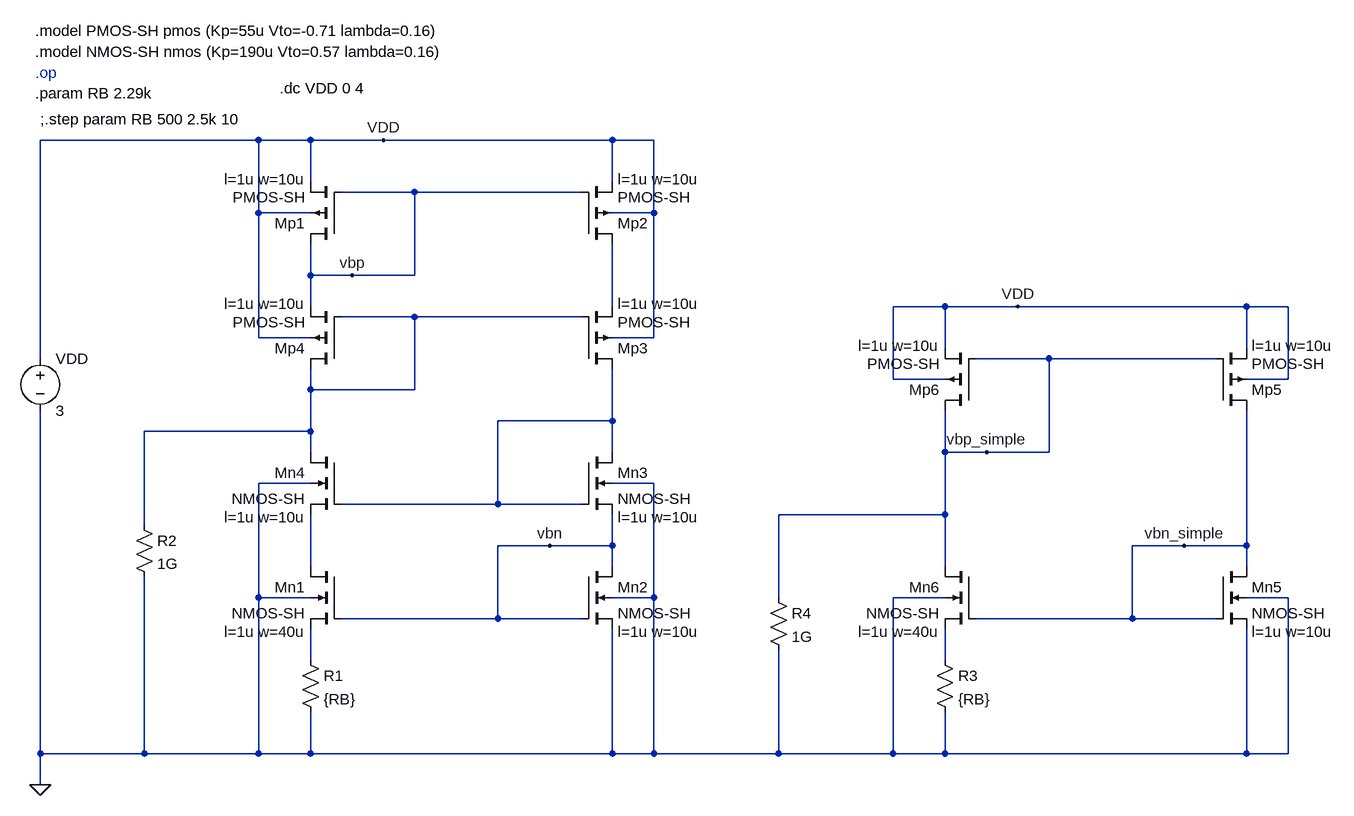
[diagram p0: schematic 2_bias_4trans_casc.asc]
2_bias_4trans_casc.asc, the LTspice schematic file:
Version 4
SHEET 1 1092 948
WIRE -864 -64 -1200 -64
WIRE -784 -64 -864 -64
WIRE -672 -64 -784 -64
WIRE -320 -64 -672 -64
WIRE -256 -64 -320 -64
WIRE -784 0 -784 -64
WIRE -320 0 -320 -64
WIRE -624 16 -736 16
WIRE -368 16 -624 16
WIRE -864 48 -864 -64
WIRE -784 48 -864 48
WIRE -256 48 -256 -64
WIRE -256 48 -320 48
WIRE -784 144 -784 96
WIRE -720 144 -784 144
WIRE -624 144 -624 16
WIRE -624 144 -720 144
WIRE -784 192 -784 144
WIRE -320 192 -320 96
WIRE 192 192 112 192
WIRE 304 192 192 192
WIRE 656 192 304 192
WIRE 720 192 656 192
WIRE -624 208 -736 208
WIRE -368 208 -624 208
WIRE -864 240 -864 48
WIRE -784 240 -864 240
WIRE -256 240 -256 48
WIRE -256 240 -320 240
WIRE 192 256 192 192
WIRE 656 256 656 192
WIRE -1200 272 -1200 -64
WIRE 352 272 240 272
WIRE 608 272 352 272
WIRE 112 304 112 192
WIRE 192 304 112 304
WIRE 720 304 720 192
WIRE 720 304 656 304
WIRE -784 320 -784 288
WIRE -624 320 -624 208
WIRE -624 320 -784 320
WIRE -320 368 -320 288
WIRE -320 368 -496 368
WIRE -784 384 -784 320
WIRE -784 384 -1040 384
WIRE -784 416 -784 384
WIRE -320 416 -320 368
WIRE 192 416 192 352
WIRE 256 416 192 416
WIRE 352 416 352 272
WIRE 352 416 256 416
WIRE -784 464 -864 464
WIRE -256 464 -320 464
WIRE -496 496 -496 368
WIRE -496 496 -736 496
WIRE -368 496 -496 496
WIRE 192 512 192 416
WIRE 192 512 -64 512
WIRE -1040 528 -1040 384
WIRE -416 560 -496 560
WIRE -320 560 -320 512
WIRE -320 560 -416 560
WIRE 560 560 480 560
WIRE 656 560 656 352
WIRE 656 560 560 560
WIRE -784 592 -784 512
WIRE -320 592 -320 560
WIRE 192 592 192 512
WIRE 656 592 656 560
WIRE -864 640 -864 464
WIRE -784 640 -864 640
WIRE -256 640 -256 464
WIRE -256 640 -320 640
WIRE -64 640 -64 512
WIRE 192 640 112 640
WIRE 720 640 656 640
WIRE -496 672 -496 560
WIRE -496 672 -736 672
WIRE -368 672 -496 672
WIRE 480 672 480 560
WIRE 480 672 240 672
WIRE 608 672 480 672
WIRE -784 736 -784 688
WIRE 192 736 192 688
WIRE -1200 880 -1200 352
WIRE -1040 880 -1040 608
WIRE -1040 880 -1200 880
WIRE -864 880 -864 640
WIRE -864 880 -1040 880
WIRE -784 880 -784 816
WIRE -784 880 -864 880
WIRE -320 880 -320 688
WIRE -320 880 -784 880
WIRE -256 880 -256 640
WIRE -256 880 -320 880
WIRE -64 880 -64 720
WIRE -64 880 -256 880
WIRE 112 880 112 640
WIRE 112 880 -64 880
WIRE 192 880 192 816
WIRE 192 880 112 880
WIRE 656 880 656 688
WIRE 656 880 192 880
WIRE 720 880 720 640
WIRE 720 880 656 880
WIRE -1200 928 -1200 880
FLAG -1200 928 0
FLAG -672 -64 VDD
FLAG -720 144 vbp
FLAG -416 560 vbn
FLAG 304 192 VDD
FLAG 256 416 vbp_simple
FLAG 560 560 vbn_simple
SYMBOL nmos4 -368 592 R0
WINDOW 123 56 100 Left 2
SYMATTR Value2 l=1u w=10u
SYMATTR InstName Mn2
SYMATTR Value NMOS-SH
SYMBOL pmos4 -368 96 M180
WINDOW 123 56 100 Left 2
SYMATTR Value2 l=1u w=10u
SYMATTR InstName Mp2
SYMATTR Value PMOS-SH
SYMBOL nmos4 -736 592 M0
WINDOW 123 56 100 Left 2
SYMATTR Value2 l=1u w=40u
SYMATTR InstName Mn1
SYMATTR Value NMOS-SH
SYMBOL res -800 720 R0
SYMATTR InstName R1
SYMATTR Value {RB}
SYMBOL voltage -1200 256 R0
WINDOW 123 0 0 Left 2
WINDOW 39 0 0 Left 2
SYMATTR InstName VDD
SYMATTR Value 3
SYMBOL pmos4 -736 96 R180
WINDOW 123 56 100 Left 2
SYMATTR Value2 l=1u w=10u
SYMATTR InstName Mp1
SYMATTR Value PMOS-SH
SYMBOL res -1056 512 R0
SYMATTR InstName R2
SYMATTR Value 1G
SYMBOL nmos4 -368 416 R0
WINDOW 123 56 100 Left 2
SYMATTR Value2 l=1u w=10u
SYMATTR InstName Mn3
SYMATTR Value NMOS-SH
SYMBOL nmos4 -736 416 M0
WINDOW 123 56 100 Left 2
SYMATTR Value2 l=1u w=10u
SYMATTR InstName Mn4
SYMATTR Value NMOS-SH
SYMBOL pmos4 -368 288 M180
WINDOW 123 56 100 Left 2
SYMATTR Value2 l=1u w=10u
SYMATTR InstName Mp3
SYMATTR Value PMOS-SH
SYMBOL pmos4 -736 288 R180
WINDOW 123 56 100 Left 2
SYMATTR Value2 l=1u w=10u
SYMATTR InstName Mp4
SYMATTR Value PMOS-SH
SYMBOL nmos4 608 592 R0
WINDOW 123 56 100 Left 2
SYMATTR Value2 l=1u w=10u
SYMATTR InstName Mn5
SYMATTR Value NMOS-SH
SYMBOL pmos4 608 352 M180
WINDOW 123 56 100 Left 2
SYMATTR Value2 l=1u w=10u
SYMATTR InstName Mp5
SYMATTR Value PMOS-SH
SYMBOL nmos4 240 592 M0
WINDOW 123 56 100 Left 2
SYMATTR Value2 l=1u w=40u
SYMATTR InstName Mn6
SYMATTR Value NMOS-SH
SYMBOL res 176 720 R0
SYMATTR InstName R3
SYMATTR Value {RB}
SYMBOL pmos4 240 352 R180
WINDOW 123 56 100 Left 2
SYMATTR Value2 l=1u w=10u
SYMATTR InstName Mp6
SYMATTR Value PMOS-SH
SYMBOL res -80 624 R0
SYMATTR InstName R4
SYMATTR Value 1G
TEXT -1208 -200 Left 2 !.model NMOS-SH nmos (Kp=190u Vto=0.57 lambda=0.16)
TEXT -1208 -168 Left 2 ;.op
TEXT -1208 -232 Left 2 !.model PMOS-SH pmos (Kp=55u Vto=-0.71 lambda=0.16)
TEXT -1208 -136 Left 2 !.param RB 2.29k
TEXT -1200 -96 Left 2 !;.step param RB 500 2.5k 10
TEXT -832 -144 Left 2 !.dc VDD 0 4

The netlist it stands for:
* 2_bias_4trans_casc.asc
Mn2 vbn vbn 0 0 NMOS-SH l=1u w=10u
Mp2 N001 vbp VDD VDD PMOS-SH l=1u w=10u
Mn1 N004 vbn N005 0 NMOS-SH l=1u w=40u
R1 N005 0 {RB}
VDD VDD 0 3
Mp1 vbp vbp VDD VDD PMOS-SH l=1u w=10u
R2 N002 0 1G
Mn3 N003 N003 vbn 0 NMOS-SH l=1u w=10u
Mn4 N002 N003 N004 0 NMOS-SH l=1u w=10u
Mp3 N003 N002 N001 VDD PMOS-SH l=1u w=10u
Mp4 N002 N002 vbp VDD PMOS-SH l=1u w=10u
Mn5 vbn_simple vbn_simple 0 0 NMOS-SH l=1u w=10u
Mp5 vbn_simple vbp_simple VDD VDD PMOS-SH l=1u w=10u
Mn6 vbp_simple vbn_simple N006 0 NMOS-SH l=1u w=40u
R3 N006 0 {RB}
Mp6 vbp_simple vbp_simple VDD VDD PMOS-SH l=1u w=10u
R4 vbp_simple 0 1G
.model NMOS NMOS
.model PMOS PMOS
.lib standard.mos
.model NMOS-SH nmos (Kp=190u Vto=0.57 lambda=0.16)
* .op
.model PMOS-SH pmos (Kp=55u Vto=-0.71 lambda=0.16)
.param RB 2.29k
;.step param RB 500 2.5k 10
.dc VDD 0 4
.backanno
.end